# Altium schematic sheet MPU-Power.SchDoc
size A4; SheetNumber: 2; SheetTotal: 7
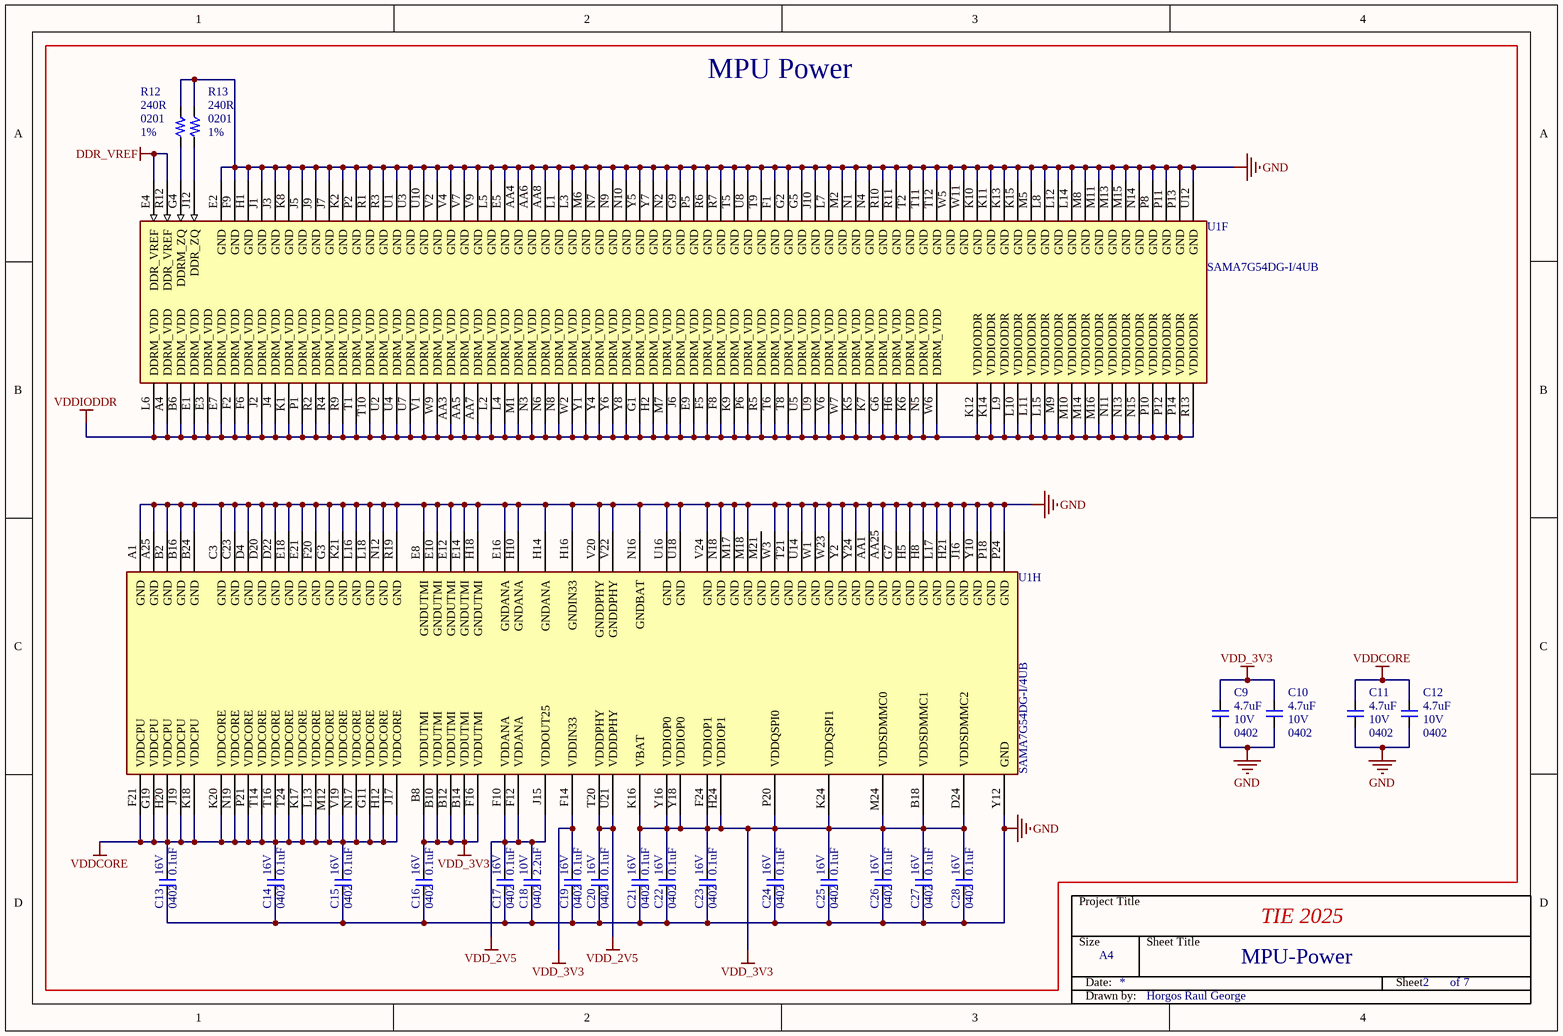
[diagram p0: MPU-Power.SchDoc]

## Parts
C9  4.7uF  Package: 0402  Rated Voltage: 10V  [CAP0402]
C10  4.7uF  Package: 0402  Rated Voltage: 10V  [CAP0402]
C11  4.7uF  Package: 0402  Rated Voltage: 10V  [CAP0402]
C12  4.7uF  Package: 0402  Rated Voltage: 10V  [CAP0402]
C13  0.1uF  Rated Voltage: 16V  Package: 0402  [CAP0402]
C14  0.1uF  Rated Voltage: 16V  Package: 0402  [CAP0402]
C15  0.1uF  Rated Voltage: 16V  Package: 0402  [CAP0402]
C16  0.1uF  Rated Voltage: 16V  Package: 0402  [CAP0402]
C17  0.1uF  Rated Voltage: 16V  Package: 0402  [CAP0402]
C18  2.2uF  Package: 0402  Rated Voltage: 10V  [CAP0402]
C19  0.1uF  Rated Voltage: 16V  Package: 0402  [CAP0402]
C20  0.1uF  Rated Voltage: 16V  Package: 0402  [CAP0402]
C21  0.1uF  Rated Voltage: 16V  Package: 0402  [CAP0402]
C22  0.1uF  Rated Voltage: 16V  Package: 0402  [CAP0402]
C23  0.1uF  Rated Voltage: 16V  Package: 0402  [CAP0402]
C24  0.1uF  Rated Voltage: 16V  Package: 0402  [CAP0402]
C25  0.1uF  Rated Voltage: 16V  Package: 0402  [CAP0402]
C26  0.1uF  Rated Voltage: 16V  Package: 0402  [CAP0402]
C27  0.1uF  Rated Voltage: 16V  Package: 0402  [CAP0402]
C28  0.1uF  Rated Voltage: 16V  Package: 0402  [CAP0402]
R12  240R  Package: 0201  Tolerance: 1%  [RES0201]
R13  240R  Package: 0201  Tolerance: 1%  [RES0201]
Title_2  Title Block  (value not drawn)  (graphical)
U1  SAMA7G54DG-I/4UB  [BGA427C80P25X21_2100X1800X120]  (parts F,H of 8)

## Nets
DDR_VREF: U1.E4(DDR_VREF) U1.R12(DDR_VREF)
GND: C9.1 C10.1 C11.1 C12.1 C13.1 C14.1 C15.1 C16.1 C17.1 C18.1 C19.1 C20.1 C21.1 C22.1 C23.1 C24.1 C25.1 C26.1 C27.1 C28.1 R12.2 R13.1 U1.A1(GND) U1.A25(GND) U1.AA1(GND) U1.AA4(GND) U1.AA6(GND) U1.AA8(GND) U1.AA25(GND) U1.B2(GND) U1.B16(GND) U1.B24(GND) U1.C3(GND) U1.C23(GND) U1.D4(GND) U1.D20(GND) U1.D22(GND) U1.E2(GND) U1.E5(GND) U1.E8(GNDUTMI) U1.E10(GNDUTMI) U1.E12(GNDUTMI) U1.E14(GNDUTMI) U1.E16(GNDANA) U1.E18(GND) U1.E21(GND) U1.F1(GND) U1.F9(GND) U1.F20(GND) U1.G2(GND) U1.G3(GND) U1.G5(GND) U1.G7(GND) U1.G9(GND) U1.H1(GND) U1.H5(GND) U1.H8(GND) U1.H10(GNDANA) U1.H14(GNDANA) U1.H16(GNDIN33) U1.H18(GNDUTMI) U1.H21(GND) U1.J1(GND) U1.J3(GND) U1.J5(GND) U1.J7(GND) U1.J9(GND) U1.J10(GND) U1.J16(GND) U1.K2(GND) U1.K8(GND) U1.K10(GND) U1.K11(GND) U1.K13(GND) U1.K15(GND) U1.K21(GND) U1.L1(GND) U1.L3(GND) U1.L5(GND) U1.L7(GND) U1.L8(GND) U1.L12(GND) U1.L14(GND) U1.L16(GND) U1.L17(GND) U1.L18(GND) U1.M2(GND) U1.M5(GND) U1.M6(GND) U1.M8(GND) U1.M11(GND) U1.M13(GND) U1.M15(GND) U1.M17(GND) U1.M18(GND) U1.N1(GND) U1.N2(GND) U1.N4(GND) U1.N7(GND) U1.N9(GND) U1.N10(GND) U1.N12(GND) U1.N14(GND) U1.N16(GNDBAT) U1.N18(GND) U1.P2(GND) U1.P5(GND) U1.P8(GND) U1.P11(GND) U1.P13(GND) U1.P18(GND) U1.P24(GND) U1.R1(GND) U1.R3(GND) U1.R6(GND) U1.R7(GND) U1.R10(GND) U1.R11(GND) U1.R19(GND) U1.T2(GND) U1.T5(GND) U1.T9(GND) U1.T11(GND) U1.T12(GND) U1.T21(GND) U1.U1(GND) U1.U3(GND) U1.U8(GND) U1.U10(GND) U1.U12(GND) U1.U14(GND) U1.U16(GND) U1.U18(GND) U1.V2(GND) U1.V4(GND) U1.V7(GND) U1.V9(GND) U1.V20(GNDDPHY) U1.V22(GNDDPHY) U1.V24(GND) U1.W1(GND) U1.W3(GND) U1.W5(GND) U1.W11(GND) U1.W23(GND) U1.Y2(GND) U1.Y5(GND) U1.Y7(GND) U1.Y10(GND) U1.Y12(GND) U1.Y24(GND)
VDD_2V5: C17.2 C18.2 C20.2 U1.F10(VDDANA) U1.F12(VDDANA) U1.J15(VDDOUT25) U1.T20(VDDDPHY) U1.U21(VDDDPHY)
VDD_3V3: C9.2 C10.2 C16.2 C19.2 C21.2 C22.2 C23.2 C24.2 C25.2 C26.2 C27.2 C28.2 U1.B8(VDDUTMI) U1.B10(VDDUTMI) U1.B12(VDDUTMI) U1.B14(VDDUTMI) U1.B18(VDDSDMMC1) U1.D24(VDDSDMMC2) U1.F14(VDDIN33) U1.F16(VDDUTMI) U1.F24(VDDIOP1) U1.H24(VDDIOP1) U1.K16(VBAT) U1.K24(VDDQSPI1) U1.M24(VDDSDMMC0) U1.P20(VDDQSPI0) U1.Y16(VDDIOP0) U1.Y18(VDDIOP0)
VDDCORE: C11.2 C12.2 C13.2 C14.2 C15.2 U1.F21(VDDCPU) U1.G11(VDDCORE) U1.G19(VDDCPU) U1.H12(VDDCORE) U1.H20(VDDCPU) U1.J17(VDDCORE) U1.J19(VDDCPU) U1.K17(VDDCORE) U1.K18(VDDCPU) U1.K20(VDDCORE) U1.L13(VDDCORE) U1.M12(VDDCORE) U1.N17(VDDCORE) U1.N19(VDDCORE) U1.P21(VDDCORE) U1.T14(VDDCORE) U1.T16(VDDCORE) U1.T24(VDDCORE) U1.V19(VDDCORE)
VDDIODDR: U1.A4(DDRM_VDD) U1.AA3(DDRM_VDD) U1.AA5(DDRM_VDD) U1.AA7(DDRM_VDD) U1.B6(DDRM_VDD) U1.E1(DDRM_VDD) U1.E3(DDRM_VDD) U1.E7(DDRM_VDD) U1.E9(DDRM_VDD) U1.F2(DDRM_VDD) U1.F5(DDRM_VDD) U1.F6(DDRM_VDD) U1.F8(DDRM_VDD) U1.G1(DDRM_VDD) U1.G6(DDRM_VDD) U1.H2(DDRM_VDD) U1.H6(DDRM_VDD) U1.J2(DDRM_VDD) U1.J4(DDRM_VDD) U1.J6(DDRM_VDD) U1.K1(DDRM_VDD) U1.K5(DDRM_VDD) U1.K6(DDRM_VDD) U1.K7(DDRM_VDD) U1.K9(DDRM_VDD) U1.K12(VDDIODDR) U1.K14(VDDIODDR) U1.L2(DDRM_VDD) U1.L4(DDRM_VDD) U1.L6(DDRM_VDD) U1.L9(VDDIODDR) U1.L10(VDDIODDR) U1.L11(VDDIODDR) U1.L15(VDDIODDR) U1.M1(DDRM_VDD) U1.M7(DDRM_VDD) U1.M9(VDDIODDR) U1.M10(VDDIODDR) U1.M14(VDDIODDR) U1.M16(VDDIODDR) U1.N3(DDRM_VDD) U1.N5(DDRM_VDD) U1.N6(DDRM_VDD) U1.N8(DDRM_VDD) U1.N11(VDDIODDR) U1.N13(VDDIODDR) U1.N15(VDDIODDR) U1.P1(DDRM_VDD) U1.P6(DDRM_VDD) U1.P10(VDDIODDR) U1.P12(VDDIODDR) U1.P14(VDDIODDR) U1.R2(DDRM_VDD) U1.R4(DDRM_VDD) U1.R5(DDRM_VDD) U1.R9(DDRM_VDD) U1.R13(VDDIODDR) U1.T1(DDRM_VDD) U1.T6(DDRM_VDD) U1.T8(DDRM_VDD) U1.T10(DDRM_VDD) U1.U2(DDRM_VDD) U1.U4(DDRM_VDD) U1.U5(DDRM_VDD) U1.U7(DDRM_VDD) U1.U9(DDRM_VDD) U1.V1(DDRM_VDD) U1.V6(DDRM_VDD) U1.W2(DDRM_VDD) U1.W6(DDRM_VDD) U1.W7(DDRM_VDD) U1.W9(DDRM_VDD) U1.Y1(DDRM_VDD) U1.Y4(DDRM_VDD) U1.Y6(DDRM_VDD) U1.Y8(DDRM_VDD)
NetR12_1: R12.1 U1.G4(DDRM_ZQ)
NetR13_2: R13.2 U1.J12(DDR_ZQ)

Not connected (* = marked no-connect by the designer): U1 M21(GND)

## Notes on the sheet
- MPU Power
- MPU-Power
- (in symbol Title Block) Project Title; TIE 2025; Size; Sheet Title; A4; Date:; Sheet; of; Drawn by:; Horgos Raul George

## Library data of the parts
C9-C12 = C1005X5R1A475K050BC: CAP CER 4.7uF 10V 10% X5R SMD 0402; Manufacturer: TDK Corporation; .Checked_PCB: AI; Manufacturer Part Number: C1005X5R1A475K050BC; .Checked_SCH: AI; .Creator: AI
C13-C17 C19-C28 = C0402C104K4RAC7867: CAP CER 0.1uF 16V 10% X7R SMD 0402; Manufacturer: KEMET; .Checked_PCB: AI; Manufacturer Part Number: C0402C104K4RAC7867; .Checked_SCH: AI; .Creator: AI
C18 = GRM155C71A225KE11J: CAP CER 2.2uF 10V 10% X7S SMD 0402; Manufacturer: Murata; .Checked_PCB: AI; Manufacturer Part Number: GRM155C71A225KE11J; .Checked_SCH: AI; .Creator: AI
R12 R13 = RC0201FR-07240RL: RES TKF 240R 1% 1/20W SMD 0201; Manufacturer: Yageo; Manufacturer Part Number: RC0201FR-07240RL
U1 = SAMA7G54DG-I/4UB: MCHP MPU SiP 32-BIT Cortex-A7 1000MHz 128kB 2Gbit / SAMA7G54D2G-I/4UB LFBGA-427; Manufacturer: Microchip Technology; Manufacturer Part Number: SAMA7G54DG-I/4UB